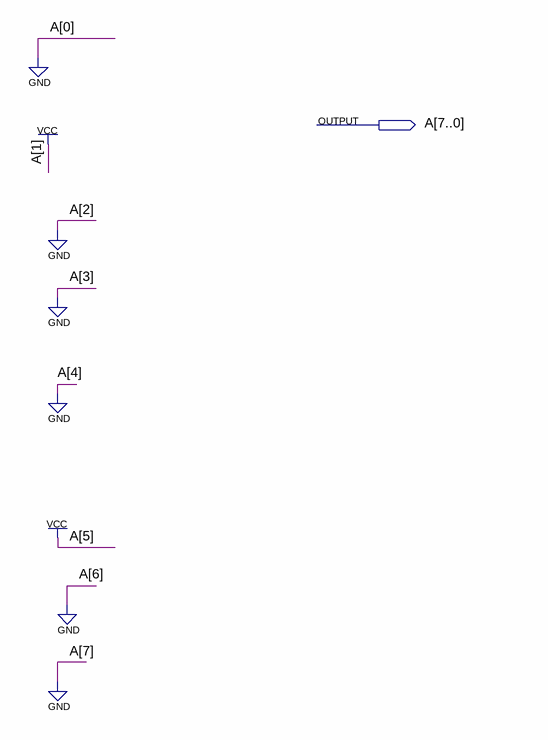
[diagram p0: schematic sheet]
// Quartus schematic C.bdf as structural Verilog: 0 symbols, 1 pins
module C (
  output [7:0] A
);


  assign A = 8'b00100010;
endmodule
